# Altium schematic sheet MCU_Sheet.SchDoc (part 1 of 2)
size 420 x 297 mm; SheetNumber: 2; SheetTotal: 5
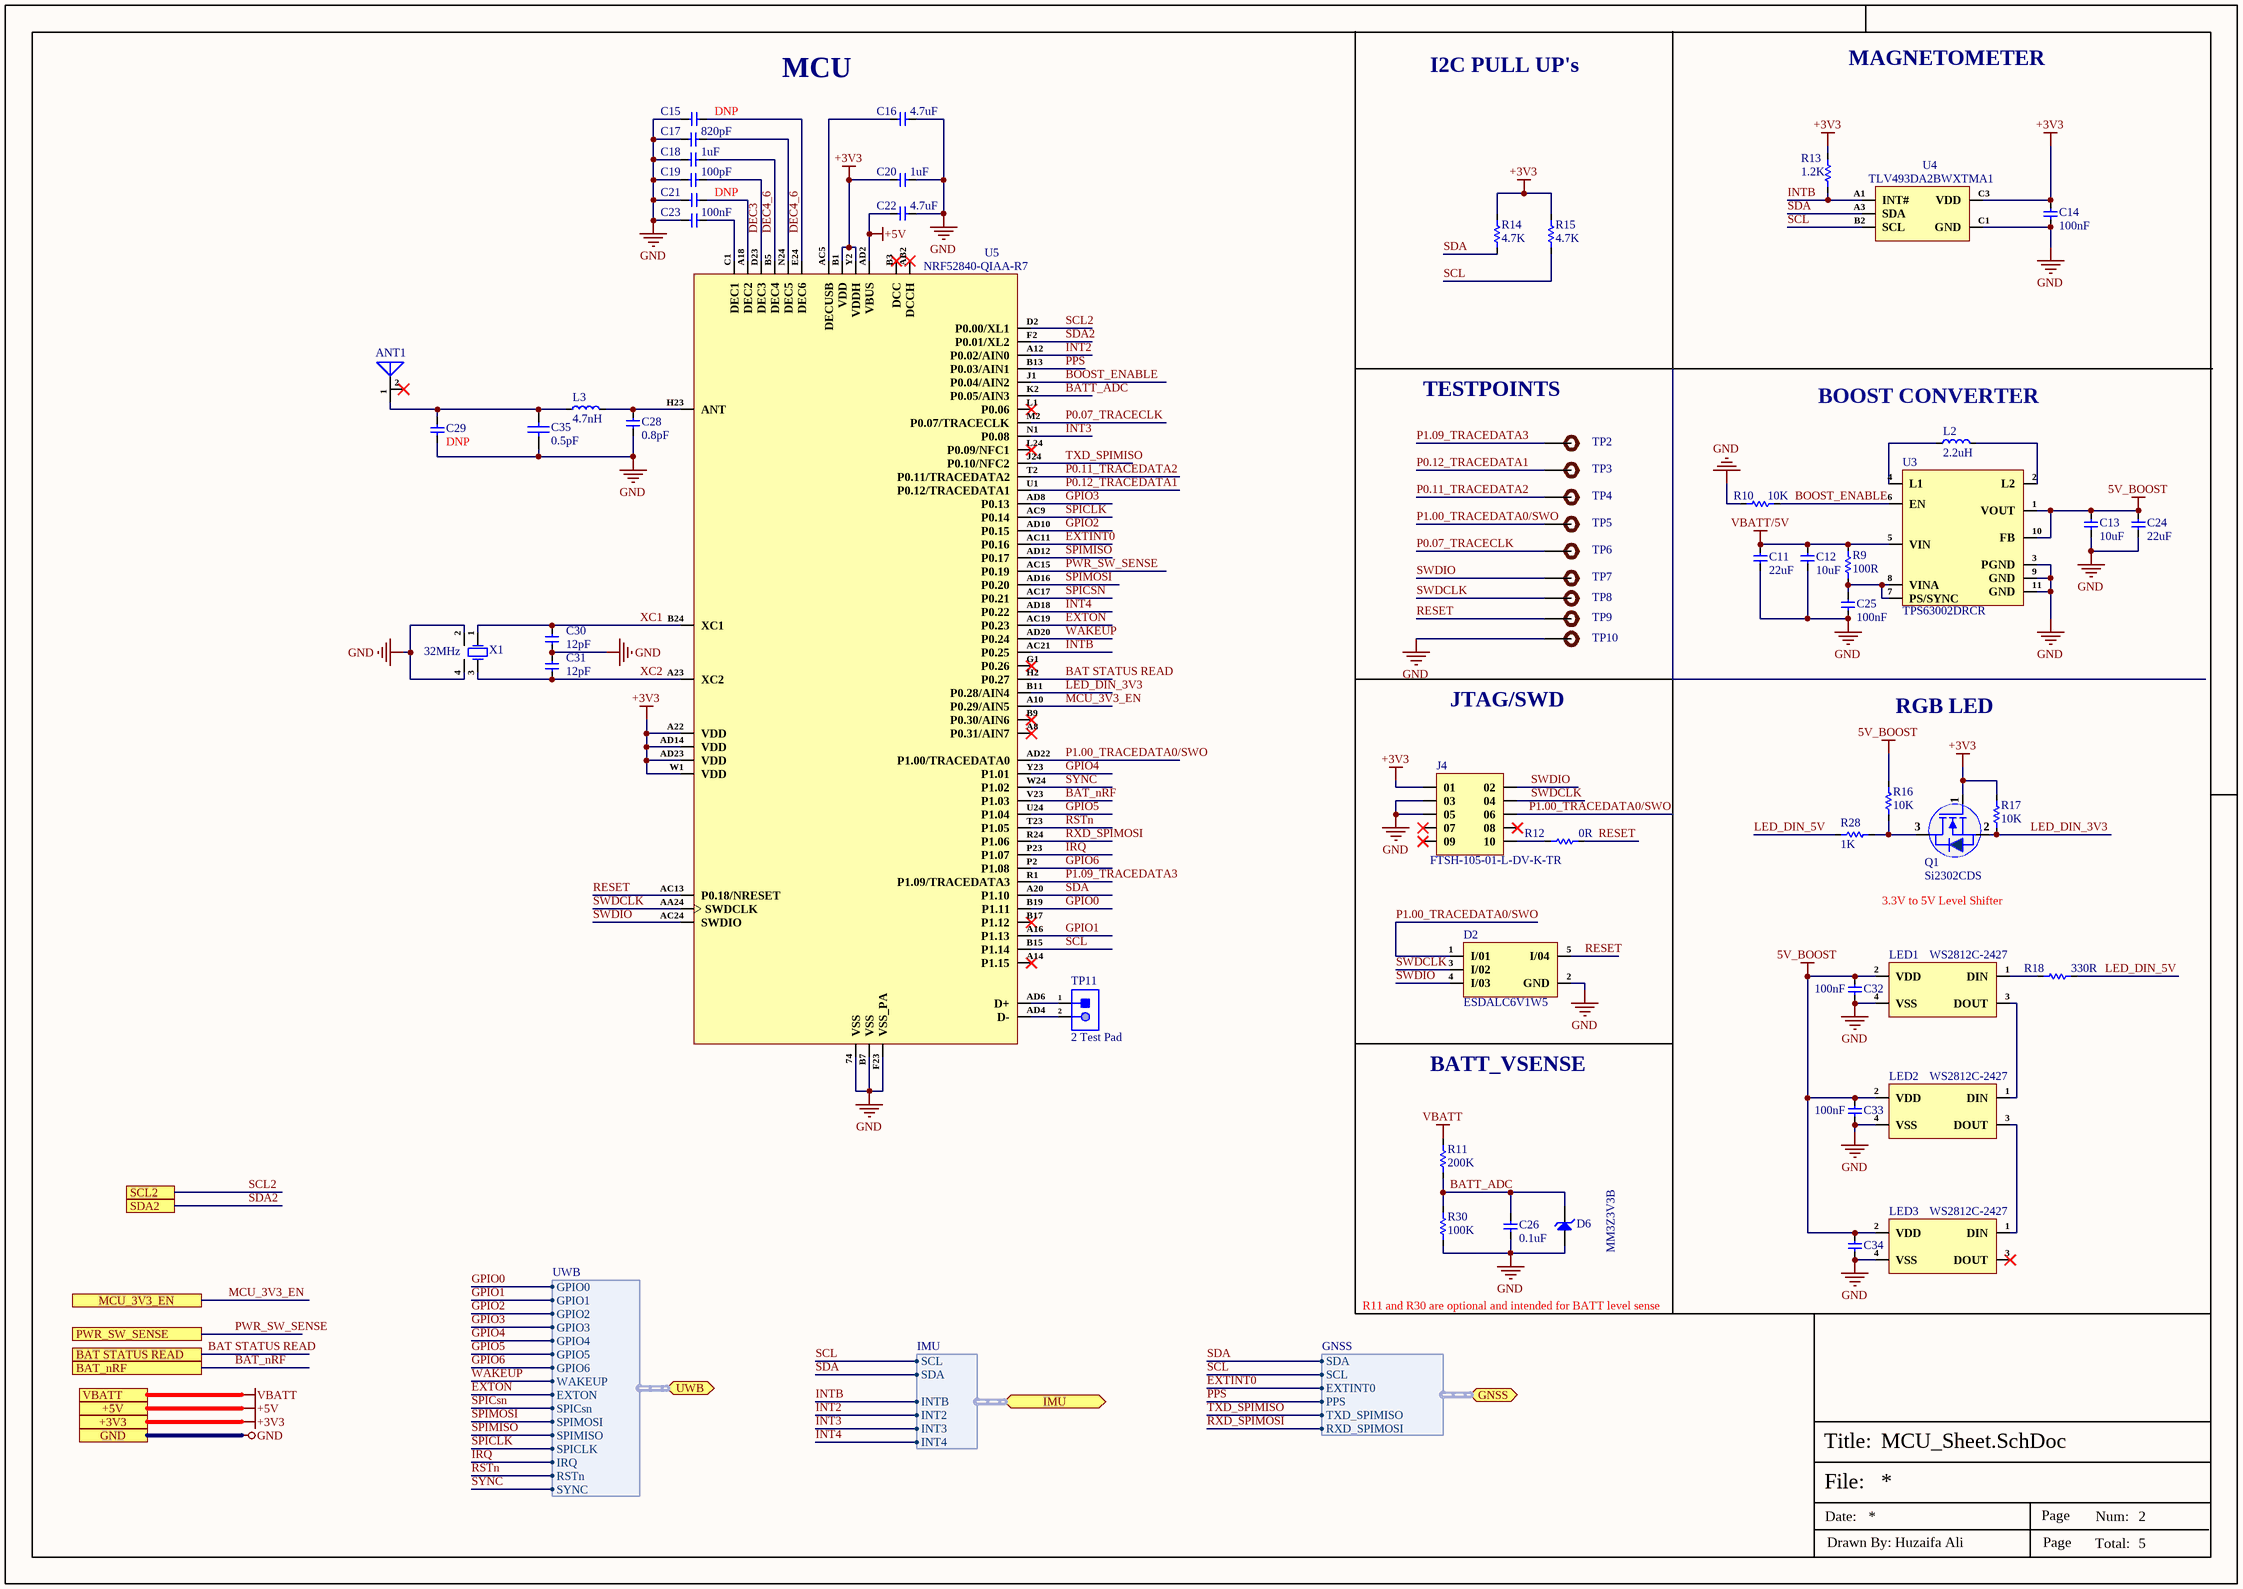
[diagram p0: MCU_Sheet.SchDoc]

## Parts
ANT1  2450AT18B100E  [ANT-1206]  (value not drawn)
C11  22uF  [Cap-0603]
C12  10uF  [Cap-0603]
C13  10uF  [Cap-0603]
C14  100nF  [cap-0402]
C15  DNP  [CAP-0201]
C16  4.7uF  [Cap-0402]
C17  820pF  [CAP-0201]
C18  1uF  [Cap-0402]
C19  100pF  [Cap-0402]
C20  1uF  [Cap-0402]
C21  DNP  [CAP-0201]
C22  4.7uF  [Cap-0402]
C23  100nF  [cap-0402]
C24  22uF  [Cap-0603]
C25  100nF  [cap-0402]
C26  0.1uF  [Cap-0402]
C28  0.8pF  [Cap-0402]
C29  DNP  [Cap-0402]
C30  12pF  [Cap-0402]
C31  12pF  [Cap-0402]
C32  100nF  [cap-0402]
C33  100nF  [cap-0402]
C34  100nF  [cap-0402]  (value not drawn)
C35  0.5pF  [CAPC1005X55X25NL05T10]
D2  ESDALC6V1W5  [SOT-323-5]
D6  MM3Z3V3B  [SOD323F]
J4  FTSH-105-01-L-DV-K-TR  [FTSH-105-01-L-DV-K-TR]
L2  2.2uH  [LQH3NPN2R2MJRL]
L3  4.7nH  [IND-0402]
LED1  WS2812C-2427  [WS2812C-2427]
LED2  WS2812C-2427  [WS2812C-2427]
LED3  WS2812C-2427  [WS2812C-2427]
Q1  Si2302CDS  [Sot-23]
R9  100R  [Res-0402]
R10  10K  [Res-0402]
R11  200K  [Res-0402]
R12  0R  [Res-0402]
R13  1.2K  [Res-0402]
R14  4.7K  [Res-0402]
R15  4.7K  [Res-0402]
R16  10K  [Res-0402]
R17  10K  [Res-0402]
R18  330R  [Res-0402]
R28  1K  [Res-0402]
R30  100K  [Res-0402]
TP2  TEST POINT 0.5mm Dia  [Test-point - 0.5mm]  (value not drawn)  (no BOM)
TP3  TEST POINT 0.5mm Dia  [Test-point - 0.5mm]  (value not drawn)  (no BOM)
TP4  TEST POINT 0.5mm Dia  [Test-point - 0.5mm]  (value not drawn)  (no BOM)
TP5  TEST POINT 0.5mm Dia  [Test-point - 0.5mm]  (value not drawn)  (no BOM)
TP6  TEST POINT 0.5mm Dia  [Test-point - 0.5mm]  (value not drawn)  (no BOM)
TP7  TEST POINT 0.5mm Dia  [Test-point - 0.5mm]  (value not drawn)  (no BOM)
TP8  TEST POINT 0.5mm Dia  [Test-point - 0.5mm]  (value not drawn)  (no BOM)
TP9  TEST POINT 0.5mm Dia  [Test-point - 0.5mm]  (value not drawn)  (no BOM)
TP10  TEST POINT 0.5mm Dia  [Test-point - 0.5mm]  (value not drawn)  (no BOM)
TP11  2 Test Pad  [2 Test Pad]  (no BOM)
U3  TPS63002DRCR  [10-VSON (3x3)]
U4  TLV493DA2BWXTMA1  [WLCSP-5(0.9x1.1)]
U5  NRF52840-QIAA-R7  [73-QFN (7x7)]
X1  32MHz  [SMD2016-4P]

## Ports
+3V3, +5V, BAT STATUS READ, BAT_nRF, GND, GNSS (bidir, harness GNSS), IMU (bidir, harness IMU), MCU_3V3_EN, PWR_SW_SENSE, SCL2, SDA2, UWB (bidir, harness UWB), VBATT

## Harnesses
UWB: GPIO0, GPIO1, GPIO2, GPIO3, GPIO4, GPIO5, GPIO6, WAKEUP, EXTON, SPICsn, SPIMOSI, SPIMISO, SPICLK, IRQ, RSTn, SYNC
GNSS: SDA, SCL, EXTINT0, PPS, TXD_SPIMISO, RXD_SPIMOSI
IMU: SCL, SDA, INTB, INT2, INT3, INT4

## Nets
5V_BOOST: C13.2 C24.2 C32.1 C33.1 C34.1 LED1.2(VDD) LED2.2(VDD) LED3.2(VDD) R16.1 U3.1(VOUT) U3.10(FB)
+3V3: C14.2 C20.1 J4.01 Q1.1(G) R13.2 R14.2 R15.2 R17.1 U4.C3(VDD) U5.A22(VDD) U5.AD14(VDD) U5.AD23(VDD) U5.B1(VDD) U5.W1(VDD) U5.Y2(VDDH) ; port +3V3
+5V: C22.1 U5.AD2(VBUS) ; port +5V
GND: C11.1 C12.1 C13.1 C14.1 C15.2 C16.2 C17.1 C18.1 C19.1 C20.2 C21.2 C22.2 C23.2 C24.1 C25.2 C26.1 C28.1 C29.1 C30.1 C31.2 C32.2 C33.2 C34.2 C35.1 D2.2(GND) D6.1(A) J4.03 J4.05 LED1.4(VSS) LED2.4(VSS) LED3.4(VSS) R10.1 R30.2 TP10.1 U3.3(PGND) U3.9(GND) U3.11(GND) U4.C1(GND) U5.74(VSS) U5.B7(VSS) U5.F23(VSS_PA) X1.2(GND) X1.4(GND) ; port GND
VBATT: R11.2 ; port VBATT
VBATT/5V: C11.2 C12.2 R9.2 U3.5(VIN)
BAT STATUS READ: U5.H2(P0.27) ; port BAT STATUS READ
BAT_nRF: U5.V23(P1.03) ; port BAT_nRF
BATT_ADC: C26.2 D6.2(K) R11.1 R30.1 U5.K2(P0.05/AIN3)
BOOST_ENABLE: R10.2 U3.6(EN) U5.J1(P0.04/AIN2)
DEC3: C19.2 U5.D23(DEC3)
DEC4_6: C15.1 C18.2 U5.B5(DEC4) U5.E24(DEC6)
EXTINT0: U5.AC11(P0.16) ; port GNSS.EXTINT0
EXTON: U5.AC19(P0.23) ; port UWB.EXTON
GPIO0: U5.B19(P1.11) ; port UWB.GPIO0
GPIO1: U5.A16(P1.13) ; port UWB.GPIO1
GPIO2: U5.AD10(P0.15) ; port UWB.GPIO2
GPIO3: U5.AD8(P0.13) ; port UWB.GPIO3
GPIO4: U5.Y23(P1.01) ; port UWB.GPIO4
GPIO5: U5.U24(P1.04) ; port UWB.GPIO5
GPIO6: U5.P2(P1.08) ; port UWB.GPIO6
INT2: U5.A12(P0.02/AIN0) ; port IMU.INT2
INT3: U5.N1(P0.08) ; port IMU.INT3
INT4: U5.AD18(P0.22) ; port IMU.INT4
INTB: R13.1 U4.A1(INT#) U5.AC21(P0.25) ; port IMU.INTB
IRQ: U5.P23(P1.07) ; port UWB.IRQ
LED_DIN_3V3: Q1.2(S) R17.2 U5.B11(P0.28/AIN4)
LED_DIN_5V: R18.2 R28.1
MCU_3V3_EN: U5.A10(P0.29/AIN5) ; port MCU_3V3_EN
P0.07_TRACECLK: TP6.1 U5.M2(P0.07/TRACECLK)
P0.11_TRACEDATA2: TP4.1 U5.T2(P0.11/TRACEDATA2)
P0.12_TRACEDATA1: TP3.1 U5.U1(P0.12/TRACEDATA1)
P1.00_TRACEDATA0/SWO: D2.1(I/01) J4.06 TP5.1 U5.AD22(P1.00/TRACEDATA0)
P1.09_TRACEDATA3: TP2.1 U5.R1(P1.09/TRACEDATA3)
PPS: U5.B13(P0.03/AIN1) ; port GNSS.PPS
PWR_SW_SENSE: U5.AC15(P0.19) ; port PWR_SW_SENSE
RESET: D2.5(I/04) R12.1 TP9.1 U5.AC13(P0.18/NRESET)
RSTn: U5.T23(P1.05) ; port UWB.RSTn
RXD_SPIMOSI: U5.R24(P1.06) ; port GNSS.RXD_SPIMOSI
SCL: R15.1 U4.B2(SCL) U5.B15(P1.14) ; port GNSS.SCL, port IMU.SCL
SCL2: U5.D2(P0.00/XL1) ; port SCL2
SDA: R14.1 U4.A3(SDA) U5.A20(P1.10) ; port GNSS.SDA, port IMU.SDA
SDA2: U5.F2(P0.01/XL2) ; port SDA2
SPICLK: U5.AC9(P0.14) ; port UWB.SPICLK
SPICSN: U5.AC17(P0.21) ; port UWB.SPICsn
SPIMISO: U5.AD12(P0.17) ; port UWB.SPIMISO
SPIMOSI: U5.AD16(P0.20) ; port UWB.SPIMOSI
SWDCLK: D2.3(I/02) J4.04 TP8.1 U5.AA24(SWDCLK)
SWDIO: D2.4(I/03) J4.02 TP7.1 U5.AC24(SWDIO)
SYNC: U5.W24(P1.02) ; port UWB.SYNC
TXD_SPIMISO: U5.J24(P0.10/NFC2) ; port GNSS.TXD_SPIMISO
WAKEUP: U5.AD20(P0.24) ; port UWB.WAKEUP
XC1: C30.2 U5.B24(XC1) X1.1(IN/OUT)
XC2: C31.1 U5.A23(XC2) X1.3(Out/In)
NetANT1_1: ANT1.1(FEED) C29.2 C35.2 L3.1
NetC16_1: C16.1 U5.AC5(DECUSB)
NetC17_2: C17.2 U5.N24(DEC5)
NetC21_1: C21.1 U5.A18(DEC2)
NetC23_1: C23.1 U5.C1(DEC1)
NetC25_1: C25.1 R9.1 U3.7(PS/SYNC) U3.8(VINA)
NetC28_2: C28.2 L3.2 U5.H23(ANT)
NetJ4_10: J4.10 R12.2
NetL2_1: L2.1 U3.4(L1)
NetL2_2: L2.2 U3.2(L2)
NetLED1_1: LED1.1(DIN) R18.1
NetLED1_3: LED1.3(DOUT) LED2.1(DIN)
NetLED2_3: LED2.3(DOUT) LED3.1(DIN)
NetQ1_3: Q1.3(D) R16.2 R28.2
NetTP11_1: TP11.1 U5.AD6(D+)
NetTP11_2: TP11.2 U5.AD4(D-)

Not connected (* = marked no-connect by the designer): ANT1 2(NC)*; J4 07* 08* 09*; LED3 3(DOUT)*; U5 A8(P0.31/AIN7)* A14(P1.15)* AB2(DCCH)* B3(DCC)* B9(P0.30/AIN6)* B17(P1.12)* G1(P0.26)* L1(P0.06)* L24(P0.09/NFC1)*

## Notes on the sheet
- MCU
- I2C PULL UP's
- MAGNETOMETER
- TESTPOINTS
- (near L2) BOOST CONVERTER
- JTAG/SWD
- RGB LED
- 3.3V to 5V Level Shifter
- BATT_VSENSE
- R11 and R30 are optional and intended for BATT level sense
- File:
- Title:
- Date:
- Page
- Num:
- Total:
- Drawn By: Huzaifa Ali